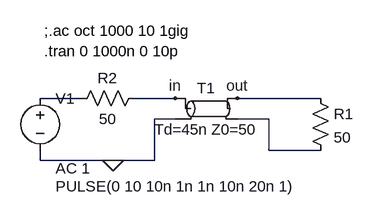
[diagram p0: schematic transmission_line.asc]
transmission_line.asc, the LTspice schematic file:
Version 4
SHEET 1 880 680
WIRE 64 144 0 144
WIRE 208 144 144 144
WIRE 432 144 304 144
WIRE 208 176 176 176
WIRE 352 176 304 176
WIRE 352 224 352 176
WIRE 432 224 352 224
WIRE 0 240 0 224
WIRE 112 240 0 240
WIRE 176 240 176 176
WIRE 176 240 112 240
FLAG 304 144 out
FLAG 208 144 in
FLAG 112 240 0
SYMBOL tline 256 160 R0
SYMATTR InstName T1
SYMATTR Value Td=45n Z0=50
SYMBOL voltage 0 128 R0
WINDOW 3 24 152 Left 2
WINDOW 123 24 124 Left 2
WINDOW 39 0 0 Left 0
SYMATTR InstName V1
SYMATTR Value PULSE(0 10 10n 1n 1n 10n 20n 1)
SYMATTR Value2 AC 1
SYMBOL res 416 128 R0
SYMATTR InstName R1
SYMATTR Value 50
SYMBOL res 48 160 R270
WINDOW 0 32 56 VTop 2
WINDOW 3 0 56 VBottom 2
SYMATTR InstName R2
SYMATTR Value 50
TEXT 6 40 Left 2 !;.ac oct 1000 10 1gig\n.tran 0 1000n 0 10p

The netlist it stands for:
* transmission_line.asc
T1 in 0 out N002 Td=45n Z0=50
V1 N001 0 PULSE(0 10 10n 1n 1n 10n 20n 1) AC 1
R1 out N002 50
R2 N001 in 50
;.ac oct 1000 10 1gig
.tran 0 1000n 0 10p
.backanno
.end